# EasyEDA Pro project ProProject_电子综合板子_李冰颜_2025-12-05.epro

# Schematic 核心板
Board Name: Board1; Create Date: 2025-11-12; Page Name: P1; Project Name: 电子综合板子_李冰颜; Schematic Name: 核心板; Update Date: 2025-11-12; Company: 嘉立创EDA; Page Size: A4; Version: V1.0
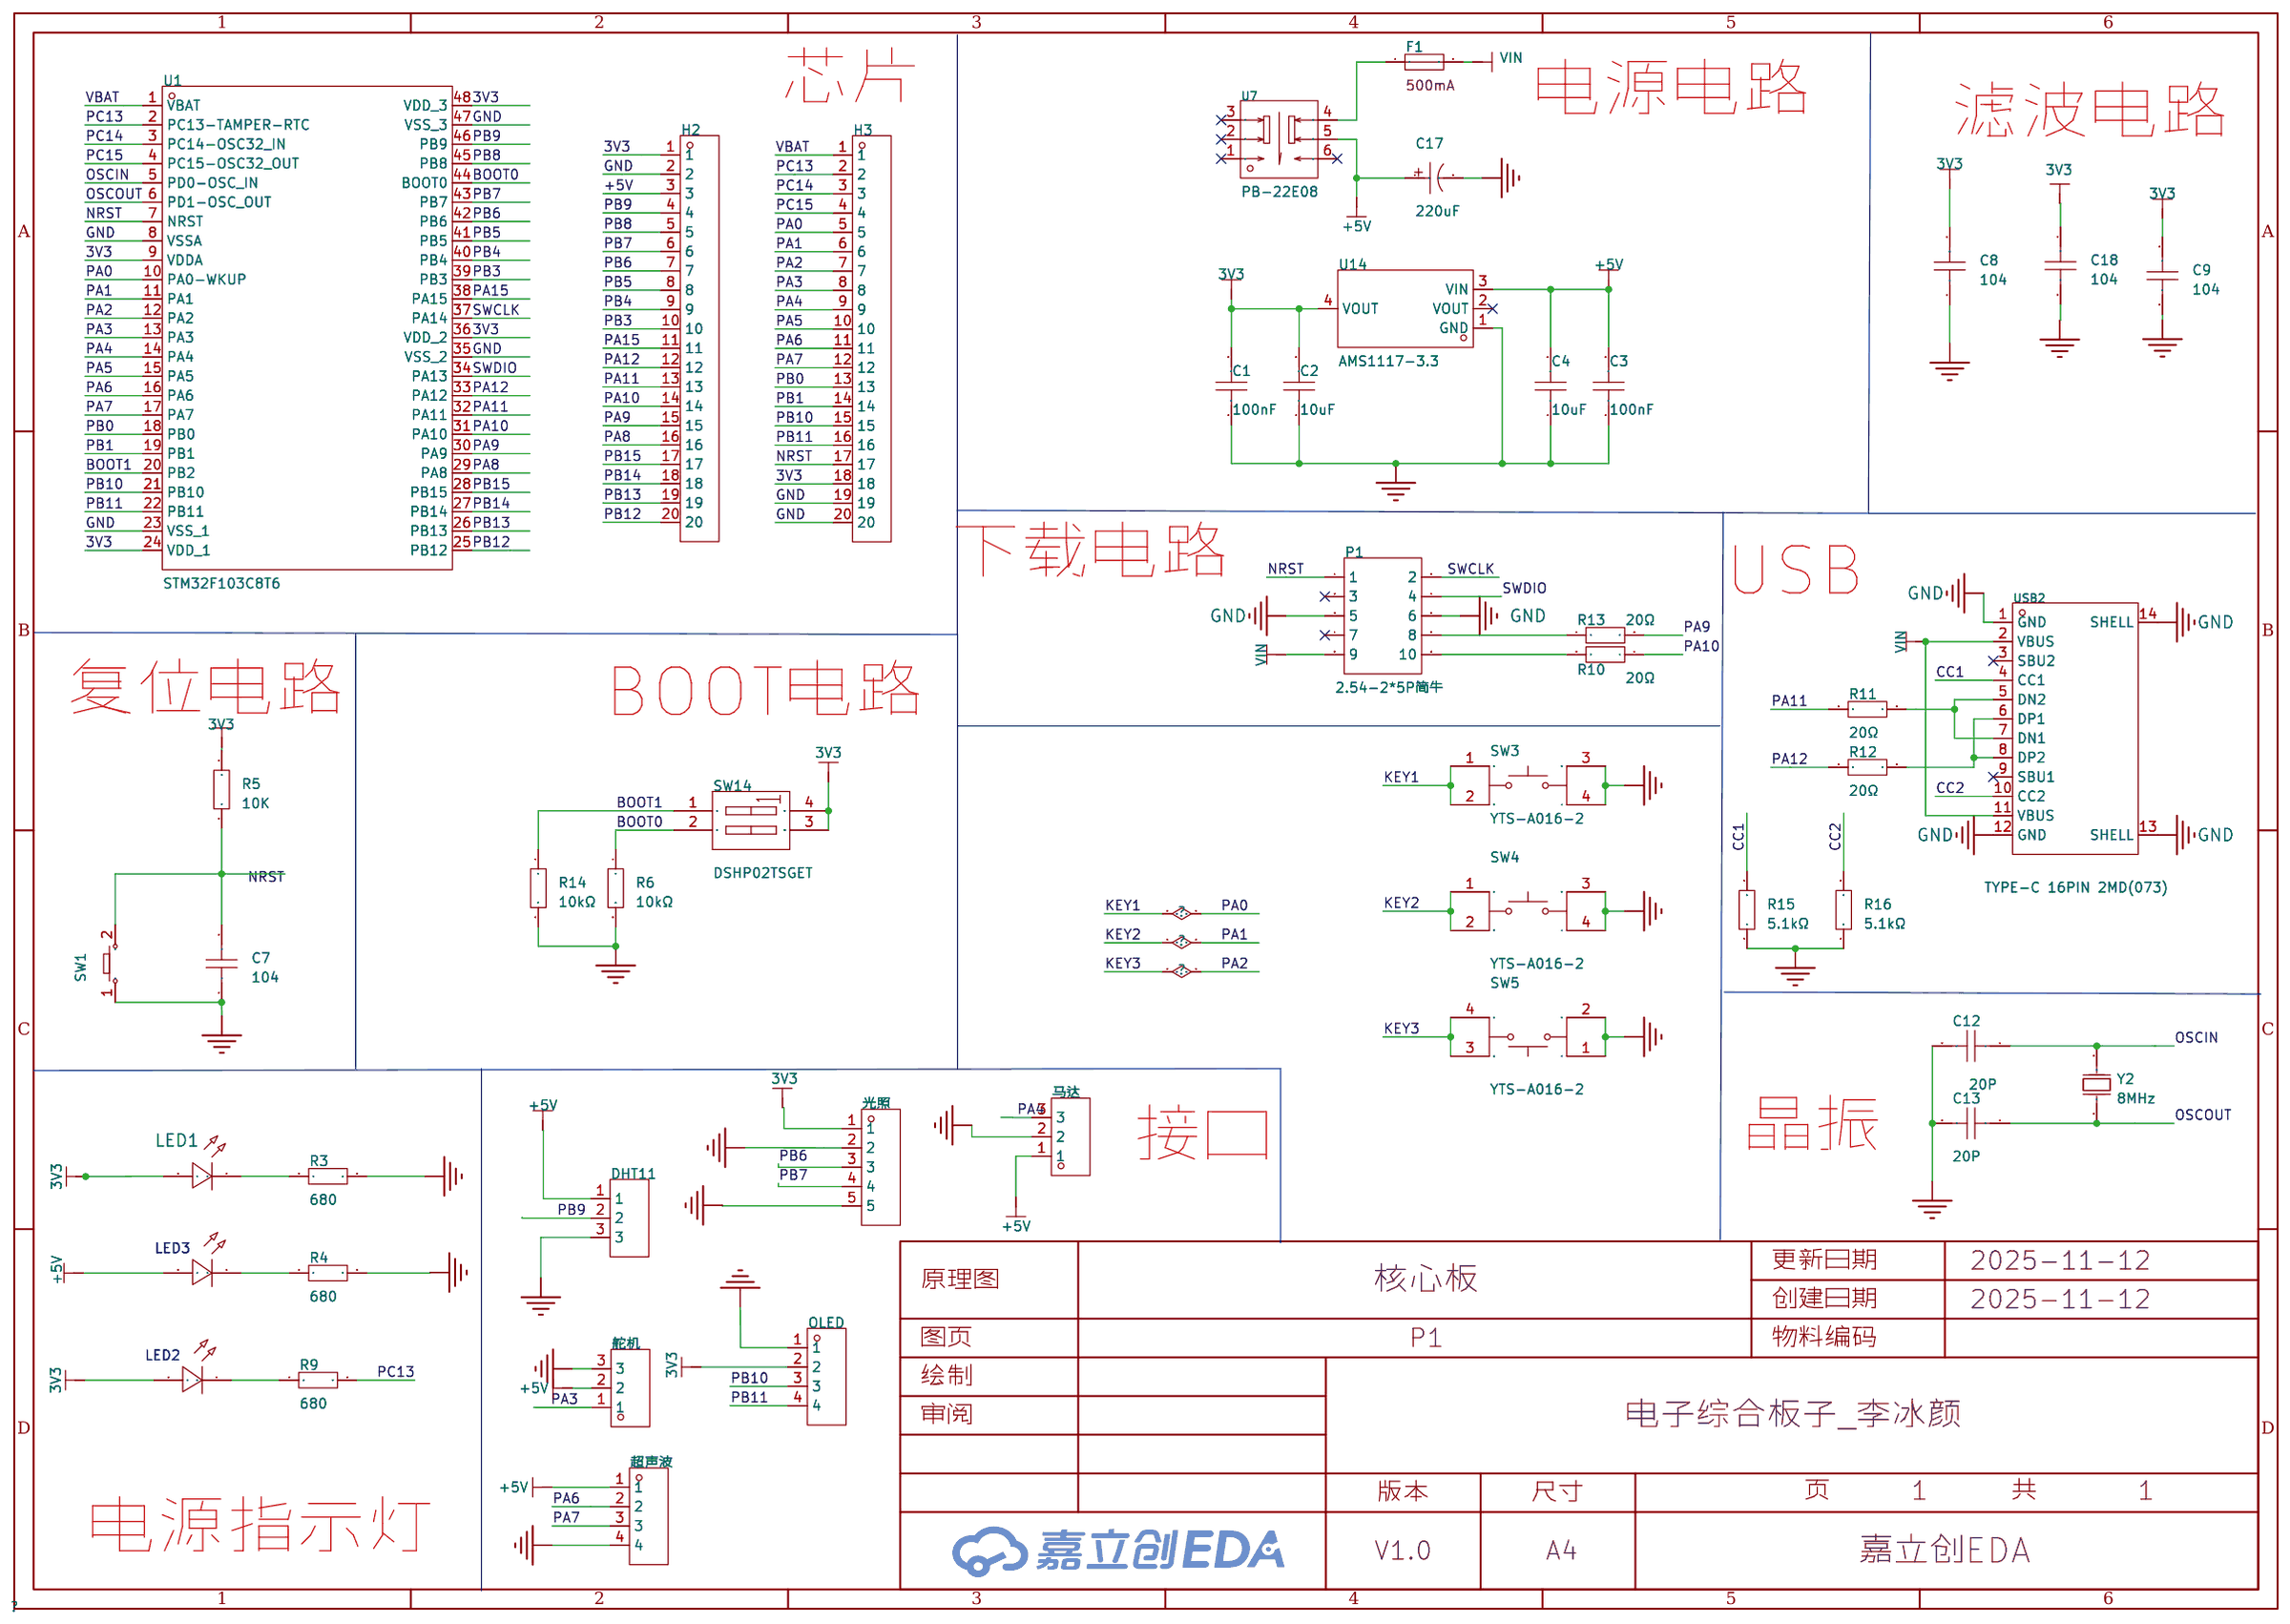
[diagram p0: schematic sheet]

## Parts
C1  100nF  [C0603]
C2  10uF  [C0603]
C3  100nF  [C0603]
C4  10uF  [C0603]
C7  104  [C0603]
C8  104  [C0603]
C9  104  [C0603]
C12  20P  [C0603]
C13  20P  [C0603]
C17  220uF  [CAP-SMD_BD6.3-L6.6-W6.6-LS7.2-R-RD]
C18  104  [C0603]
DHT11  PM254V-11-03-H85  [HDR-TH_3P-P2.54-V-F]
F1  BSMD0805-020-30V  [F0805]
H2  -  [HDR-TH_20P-P2.54-V-M-1]
H3  -  [HDR-TH_20P-P2.54-V-M-1]
LED1  -  [LED_0603]
LED2  -  [LED_0603]
LED3  -  [LED_0603]
OLED  PM254V-11-04-H85  [HDR-TH_4P-P2.54-V-F]
P1  2.54-2*5P简牛  [IDC-TH_10P-P2.54_C5665]
R3  680  [R0603]
R4  680  [R0603]
R5  10K  [R0603]
R6  10kΩ  [R0603]
R9  680  [R0603]
R10  20Ω  [R0603]
R11  20Ω  [R0603]
R12  20Ω  [R0603]
R13  20Ω  [R0603]
R14  10kΩ  [R0603]
R15  5.1kΩ  [R0603]
R16  5.1kΩ  [R0603]
SW1  -  [Key_SMD_3x4x2]
SW3  YTS-A016-2  [SW-SMD_4P-L4.2-W3.3-P2.15-LS4.7]
SW4  YTS-A016-2  [SW-SMD_4P-L4.2-W3.3-P2.15-LS4.7]
SW5  YTS-A016-2  [SW-SMD_4P-L4.2-W3.3-P2.15-LS4.7]
SW14  DSHP02TSGET  [SW-SMD_4P_DSHP02TSGET]
U1  STM32F103C8T6  [LQFP-48_L7.0-W7.0-P0.50-LS9.0-BL]
U7  PB-22E08  [SW-TH_6P-L8.0-W8.0-P2.50_PB-22E08]
U14  AMS1117-3.3  [SOT-223-3_L6.5-W3.4-P2.30-LS7.0-BR]
USB2  TYPE-C 16PIN 2MD(073)  [USB-C-SMD_TYPE-C-6PIN-2MD-073]
Y2  8MHz  [HC-49S_L11.4-W4.7-P4.88-D0.4]
光照  PM254V-11-05-H85  [HDR-TH_5P-P2.54-V-F]
舵机  -  [HDR-TH_3P-P2.54-V-M]
超声波  -  [HDR-TH_4P-P2.54-V-M]
马达  -  [HDR-TH_3P-P2.54-V-M]

## Library data of the parts
C1-C4 C7-C9 C12 C13 C18 = CAP_0603: Supplier Footprint: 0603
C17 = RVT1A221M0605: 容值:220uF;精度:±20%;额定电压:10V;纹波电流:-;等效串联电阻:-;; LCSC Part Name: 220uF ±20% 10V; Supplier Part: C3345; Manufacturer: HONOR(荣誉); Supplier Footprint: SMD,D6.3xL5.4mm; JLCPCB Part Class: 扩展库; Datasheet: https://atta.szlcsc.com/upload/public/pdf/source/20220520/1BCC52842751E84E020A4D0B70BC5F88.pdf; Supplier: LCSC; Tolerance: ±20%; Rated Voltage: 10V; φD: 6.3mm; L: 5.4mm; Lifetime @ Temp: 2000hrs@105℃; Operating Temperature: -55℃~+105℃
DHT11 = PM254V-11-03-H85: 插孔结构:1x3P;间距:2.54mm;行距:-;圆孔/方孔:方孔;安装方式:直插;排数:单排;总孔位数:3P;额定电流:3A;插孔方向:顶部;塑高:8.5mm;触头材质:黄铜;触头镀层:-;工作温度:-40℃~+105℃;; LCSC Part Name: 1x3P 间距:2.54mm 直插; Supplier Part: C541850; Manufacturer: XFCN(兴飞); Supplier Footprint: 插件,P=2.54mm; JLCPCB Part Class: 扩展库; Datasheet: https://item.szlcsc.com/datasheet/PM254V-11-03-H85/562471.html; Supplier: LCSC; Holes Structure: 1x3P; Pitch: 2.54mm; Circular Hole / Square Hole: 方孔; Mounting Type: 直插; Number of Rows: 单排; Number of Positions: 3P; Current Rating: 3A; Holes Direction: 顶部; Insulation Height: 8.5mm; Contact Material: 黄铜; Operating Temperature: -40℃~+105℃
F1 = BSMD0805-020-30V: 最大电压:30V;最大电流:40A;保持电流:200mA;跳闸电流:500mA;; LCSC Part Name: 30V 200mA 0805自恢复; Supplier Part: C883105; Manufacturer: BHFUSE(佰宏); Supplier Footprint: 0805; JLCPCB Part Class: 扩展库; Datasheet: https://atta.szlcsc.com/upload/public/pdf/source/20220223/3FD8E8A8A3681642EAEF465E16495357.pdf; Supplier: LCSC; Operating Voltage (Max): 30V; Current Rating (Max): 40A; Hold Current: 200mA; Trip Current: 500mA; Power Dissipation: 500mW; Resistance - Initial (Ri) (Min): 500mΩ; Resistance - Post Trip (R1) (Max): 3.5Ω; Maximum Time to Trip: 20ms; Operating Temperature: -40℃~+85℃
H2 H3 = HDR-M_2.54_1x20P: 间距:2.54mm;总PIN位数:20;排数:1;插针结构:-;行距:-;安装类型:直插;圆针/方针:-;额定电流:-;额定电压:-;配合针长度:-;塑高:-;触头材质:黄铜;触头镀层:-;颜色:黑色;; Supplier Part: C50981; Supplier Footprint: 插件
LED1 = LED_0603-R: Supplier Footprint: 0603
LED2 LED3 = LED_0603-B: Supplier Footprint: 0603
OLED = PM254V-11-04-H85: 插孔结构:1x4P;间距:2.54mm;行距:-;圆孔/方孔:方孔;安装方式:直插;排数:单排;总孔位数:4P;额定电流:3A;插孔方向:顶部;塑高:8.5mm;触头材质:黄铜;触头镀层:-;工作温度:-40℃~+105℃;; LCSC Part Name: 1x4P 间距:2.54mm 直插; Supplier Part: C541851; Manufacturer: XFCN(兴飞); Supplier Footprint: 插件,P=2.54mm; JLCPCB Part Class: 扩展库; Datasheet: https://item.szlcsc.com/datasheet/PM254V-11-04-H85/562472.html; Supplier: LCSC; Holes Structure: 1x4P; Pitch: 2.54mm; Circular Hole / Square Hole: 方孔; Mounting Type: 直插; Number of Rows: 单排; Number of Positions: 4P; Current Rating: 3A; Holes Direction: 顶部; Insulation Height: 8.5mm; Contact Material: 黄铜; Operating Temperature: -40℃~+105℃
P1 = 2.54-2*5P简牛: 连接器类型:简牛座;每排PIN数:5;排数:2;间距:2.54mm;行距:2.54mm;封装形式:直插;触头材质:-;触头镀层:-;; LCSC Part Name: 每排P数:5 排数:2 2.54mm; Supplier Part: C5665; Manufacturer: BOOMELE(博穆精密); Supplier Footprint: 插件,P=2.54mm; JLCPCB Part Class: 扩展库; Datasheet: https://atta.szlcsc.com/upload/public/pdf/source/20140331/1457707037896.pdf; Supplier: LCSC; Connector Type: 简牛座; Pin Number in each Row: 5; Number of Rows: 2; Pitch: 2.54mm; Row Spacing: 2.54mm; Holder Type: 直插
R3-R5 R9 = Res_0603: Supplier Footprint: 0603
R6 R14 = RC0603JR-0710KL: 电阻类型:厚膜电阻;阻值:10kΩ;精度:±5%;功率:100mW;; LCSC Part Name: 10kΩ ±5% 100mW; Supplier Part: C99198; Manufacturer: YAGEO(国巨); Supplier Footprint: 0603; JLCPCB Part Class: 扩展库; Datasheet: https://atta.szlcsc.com/upload/public/pdf/source/20181223/C99198_917934A193F41F77D9F7D214A8C79116.pdf; Supplier: LCSC; Type: 厚膜电阻; Tolerance: ±5%; Power(Watts): 100mW; Temperature Coefficient: ±100ppm/℃; Overload Voltage (Max): 75V; Operating Temperature Range: -55℃~+155℃
R10-R13 = 0603WAF200JT5E: 电阻类型:厚膜电阻;阻值:20Ω;精度:±1%;功率:100mW;; LCSC Part Name: 20Ω ±1% 100mW; Supplier Part: C22950; Manufacturer: UNI-ROYAL(厚声); Supplier Footprint: 0603; JLCPCB Part Class: Basic Part; Datasheet: https://atta.szlcsc.com/upload/public/pdf/source/20200306/C422600_1E6D84923E4A46A82E41ADD87F860B5C.pdf; Supplier: LCSC; Type: 厚膜电阻; Tolerance: ±1%; Power(Watts): 100mW; Temperature Coefficient: ±100ppm/℃; Overload Voltage (Max): 75V; Operating Temperature Range: -55℃~+155℃
R15 R16 = RMC1/16K512FTP63: 阻值:5.1kΩ;精度:±1%;功率:100mW;温度系数:±100ppm/℃;; LCSC Part Name: 5.1kΩ ±1% 100mW 停产; Supplier Part: C340528; Manufacturer: KAMAYA(釜屋電機); Supplier Footprint: 0603; Datasheet: https://atta.szlcsc.com/upload/public/pdf/source/20190312/C340533_57182A1F90EF0B6BEC7E870D19457F7C.pdf; Supplier: LCSC; Tolerance: ±1%; Power(Watts): 100mW; Temperature Coefficient: ±100ppm/℃
SW1 = Key_SMD_3x4x2: Supplier Footprint: SMD
SW3-SW5 = YTS-A016-2: 电路结构:单刀单掷;按钮形状:椭圆形按钮;作用力:2.6N;安装方式:立贴;开关长度:4.2mm;开关宽度:3.4mm;开关高度:2.5mm;带支架:不带;触点电流:50mA;额定电压(DC):12V;绝缘电阻:100MΩ;机械寿命:10万次;; LCSC Part Name: 4.2*3.4*2.5mm 立贴 轻触开关; Supplier Part: C2910673; Manufacturer: YIYUAN(怡远); Supplier Footprint: SMD; JLCPCB Part Class: 扩展库; Datasheet: https://atta.szlcsc.com/upload/public/pdf/source/20211104/F07B7201482F381EAEC9C23BE16B5334.pdf; Supplier: LCSC; Circuit: 单刀单掷; Actuator Style: 椭圆形按钮; Operating Force: 2.6N; Mounting Style: 立贴; Switch Length: 4.2mm; Switch Width: 3.4mm; Switch Height: 2.5mm; Strike Gundam: 不带; Contact Current: 50mA; Voltage Rating (DC): 12V; Insulation Resistance: 100MΩ; Actuator/Cap Color: 白色; Pin Style: J型引脚; Mechanical Life: 10万次
SW14 = DSHP02TSGET: 类型:平拨，凹槽式;电路结构:单刀单掷;开关位数:2;引脚间距:1.27mm;颜色:黑色;; LCSC Part Name: 2位 1.27间距; Supplier Part: C40735; Manufacturer: YE; Supplier Footprint: SMD-4P,4.1x5.4mm; JLCPCB Part Class: 扩展库; Datasheet: https://atta.szlcsc.com/upload/public/pdf/source/20150928/1457707425261.pdf; Supplier: LCSC; Type: 平拨，凹槽式; Circuit: 单刀单掷; Number of Positions: 2; Lead Pitch: 1.27mm; Color: 黑色
U1 = STM32F103C8T6: CPU内核:ARM-M3;程序存储容量:64KB;RAM总容量:20KB;GPIO端口数量:37;工作电压范围:2V~3.6V;CPU最大主频:72MHz;程序存储器类型:FLASH;; LCSC Part Name: 主流增强型ARM Cortex-M3 MCU，具有64 KB Flash、72 MHz CPU、电机控制、USB和CAN; Supplier Part: C8734; Manufacturer: ST(意法半导体); Supplier Footprint: LQFP-48(7x7); JLCPCB Part Class: 扩展库; Datasheet: https://atta.szlcsc.com/upload/public/pdf/source/20220812/8363ACEC51AD55ECEB84799464F7CB85.pdf; Supplier: LCSC; CPU Core: ARM-M3; Program Storage Size: 64KB; RAM Size: 20KB; GPIO Ports Number: 37; Operating Voltage Range: 2V~3.6V; CPU Maximum Speed: 72MHz; Program Memory Type: FLASH; Operating Temperature Range: -40℃~+85℃; ADC (Bit): 12bit; Universal Serial Bus: 有; Peripheral/Function: 看门狗；DMA；看门狗；温度传感器; Watchdog: 有; Infrared Data Association: 有; Low-Voltage Detect: 有; Direct Memory Access: 有; Internal Oscillator: 有
U7 = PB-22E08: LCSC Part Name: 自锁按键开关; Supplier Part: C2848958; Manufacturer: G-Switch(品赞); Supplier Footprint: 8x8mm; Datasheet: https://atta.szlcsc.com/upload/public/pdf/source/20230616/E4440AC7CE198A071B7CAB3CD31ABBEA.pdf; Supplier: LCSC
U14 = AMS1117-3.3_C6186: 输出类型:固定;最大输入电压:-;输出电压:3.3V;最大输出电流:1A;电源纹波抑制比(PSRR):72dB@(120Hz);输出极性:正极;; LCSC Part Name: 输出3.3V 1A; Supplier Part: C6186; Manufacturer: AMS; Supplier Footprint: SOT-223-3; JLCPCB Part Class: 基础库; Datasheet: https://atta.szlcsc.com/upload/public/pdf/source/20180727/C6186_7A095716F0823C02F1997A905E26C086.pdf; Supplier: LCSC; Output Type: 固定; Output Voltage: 3.3V; MAX Output Current: 1A; Power Supply Rejection Ratio (PSRR): 72dB@(120Hz); Dropout Voltage: 1.3V@(800mA); Output Polarity: 正极; Number of Outputs: 1
USB2 = TYPE-C 16PIN 2MD(073): 连接器类型:Type-C;标准:-;公母:母座;触点数量:16;端口数量:1;安装方式:卧贴;额定电流 - 电源:5A;工作温度范围:-25℃~+85℃;; LCSC Part Name: TYPE-C母座 16P 4脚插件带定位柱 不锈钢外壳 2次模顶; Supplier Part: C2765186; Manufacturer: SHOU HAN(首韩); Supplier Footprint: SMD; JLCPCB Part Class: 扩展库; Datasheet: https://item.szlcsc.com/datasheet/TYPE-C%252016PIN%25202MD(073)/2901843.html; Supplier: LCSC; Connector Type: Type-C; Gender: 母座; Mounting Type: 卧贴; Number of Contacts: 16; Number of Ports: 1; Current Rating-Power: 3A; Voltage Rating: 5V; Connect-Disconnect Life: 5千次; Detection color: 黑色; Operating Temperature: -25℃~+85℃; Mounting Style: 卧贴; Current Rating - Power (Max): 5A; Operating Temperature Range: -25℃~+85℃
Y2 = ECS-080-20-4X-DU: 频率:8MHz;常温频差:±30ppm;外接负载电容:20pF;频率稳定度(全温):±100ppm;; LCSC Part Name: 8MHz ±30ppm 20pF; Supplier Part: C2636160; Manufacturer: ECS; Supplier Footprint: HC-49S; JLCPCB Part Class: 扩展库; Datasheet: https://atta.szlcsc.com/upload/public/pdf/source/20181031/C312311_8C746D9B0903A43D812CE762944D4B2E.pdf; Supplier: LCSC; Normal temperature Frequency Tolerance: ±30ppm; External load capacitor: 20pF; Frequency Stability(Full temperature range): ±100ppm; Equivalent Series Resistance (ESR): 80Ω; Operating Temperature: -55℃~+125℃
光照 = PM254V-11-05-H85: 插孔结构:1x5P;间距:2.54mm;行距:-;圆孔/方孔:方孔;安装方式:直插;排数:单排;总孔位数:5P;额定电流:3A;插孔方向:顶部;塑高:8.5mm;触头材质:黄铜;触头镀层:-;工作温度:-40℃~+105℃;; LCSC Part Name: 1x5P 间距:2.54mm 直插; Supplier Part: C541852; Manufacturer: XFCN(兴飞); Supplier Footprint: 插件,P=2.54mm; JLCPCB Part Class: 扩展库; Datasheet: https://item.szlcsc.com/datasheet/PM254V-11-05-H85/562473.html; Supplier: LCSC; Holes Structure: 1x5P; Pitch: 2.54mm; Circular Hole / Square Hole: 方孔; Mounting Type: 直插; Number of Rows: 单排; Number of Positions: 5P; Current Rating: 3A; Holes Direction: 顶部; Insulation Height: 8.5mm; Contact Material: 黄铜; Operating Temperature: -40℃~+105℃
舵机 马达 = HDR-M_2.54_1x3P: Supplier Part: C2937625; Supplier Footprint: 插件
超声波 = HDR-M_2.54_1x4P: Supplier Part: C492403; Supplier Footprint: 插件

## Nets
3V3: C1.2 C2.2 C18.1 H2.1 H3.18 LED2.2(A) OLED.2 SW14.3(B2) SW14.4(B1) U1.9(VDDA) U1.24(VDD_1) U14.4(VOUT)
+5V: C3.2 C4.2 H2.3 U14.3(VIN) 舵机.2
GND: C1.1 C2.1 C3.1 C4.1 C7.1 C18.2 H2.2 H3.19 H3.20 OLED.1 R6.2 R14.2 R15.1 R16.1 SW3.3 SW3.4 SW4.3 SW4.4 SW5.1 SW5.2 U1.8(VSSA) U1.23(VSS_1) U14.1(GND) USB2.1(GND) USB2.12(GND) USB2.13(SHELL) USB2.14(SHELL) 舵机.3 马达.2
VBAT: H3.1 U1.1(VBAT)
VIN: USB2.2(VBUS) USB2.11(VBUS)
BOOT0: R6.1 SW14.2(A2)
BOOT1: R14.1 SW14.1(A1) U1.20(PB2)
CC1: R15.2 USB2.4(CC1)
CC2: R16.2 USB2.10(CC2)
KEY1: H3.5 SW3.1 SW3.2 U1.10(PA0-WKUP)
KEY2: H3.6 SW4.1 SW4.2 U1.11(PA1)
KEY3: H3.7 SW5.3 SW5.4 U1.12(PA2)
NRST: H3.17 U1.7(NRST)
OSCIN: U1.5(PD0-OSC_IN) Y2.2
OSCOUT: U1.6(PD1-OSC_OUT) Y2.1
PA3: H3.8 U1.13(PA3) 舵机.1
PA4: H3.9 U1.14(PA4)
PA5: H3.10 U1.15(PA5)
PA6: H3.11 U1.16(PA6)
PA7: H3.12 U1.17(PA7)
PA8: H2.16
PA9: H2.15
PA10: H2.14
PA11: H2.13 R11.1
PA12: H2.12 R12.1
PA15: H2.11
PB0: H3.13 U1.18(PB0)
PB1: H3.14 U1.19(PB1)
PB3: H2.10
PB4: H2.9
PB5: H2.8
PB6: H2.7 光照.3
PB7: H2.6 光照.4
PB8: H2.5
PB9: H2.4
PB10: H3.15 OLED.3 U1.21(PB10)
PB11: H3.16 OLED.4 U1.22(PB11)
PB12: H2.20
PB13: H2.19
PB14: H2.18
PB15: H2.17
PC13: H3.2 R9.2 U1.2(PC13-TAMPER-RTC)
PC14: H3.3 U1.3(PC14-OSC32_IN)
PC15: H3.4 U1.4(PC15-OSC32_OUT)
$1N1999: LED2.1(C) R9.1
Net-(USB2-5): USB2.5(DN2) USB2.7(DN1)
Net-(USB2-6): USB2.6(DP1) USB2.8(DP2)

Not connected (* = marked no-connect by the designer): C7 2; C8 1 2; C9 1 2; C12 1 2; C13 1 2; C17 1 2; DHT11 1 2 3; F1 1 2; LED1 1(C) 2(A); LED3 1(C) 2(A); P1 1 2 3* 4 5 6 7* 8 9 10; R3 1 2; R4 1 2; R5 1 2; R10 1 2; R11 2; R12 2; R13 1 2; SW1 1 2; U1 25(PB12) 26(PB13) 27(PB14) 28(PB15) 29(PA8) 30(PA9) 31(PA10) 32(PA11) 33(PA12) 34(PA13) 35(VSS_2) 36(VDD_2) 37(PA14) 38(PA15) 39(PB3) 40(PB4) 41(PB5) 42(PB6) 43(PB7) 44(BOOT0) 45(PB8) 46(PB9) 47(VSS_3) 48(VDD_3); U7 1* 2* 3* 4 5 6*; U14 2(VOUT)*; USB2 3(SBU2)* 9(SBU1)*; 光照 1 2 5; 超声波 1 2 3 4; 马达 1 3

## Notes on the sheet
- 芯片
- 电源电路
- 滤波电路
- 下载电路
- USB
- 复位电路
- BOOT电路
- 接口
- 晶振
- 电源指示灯

# Board PCB1
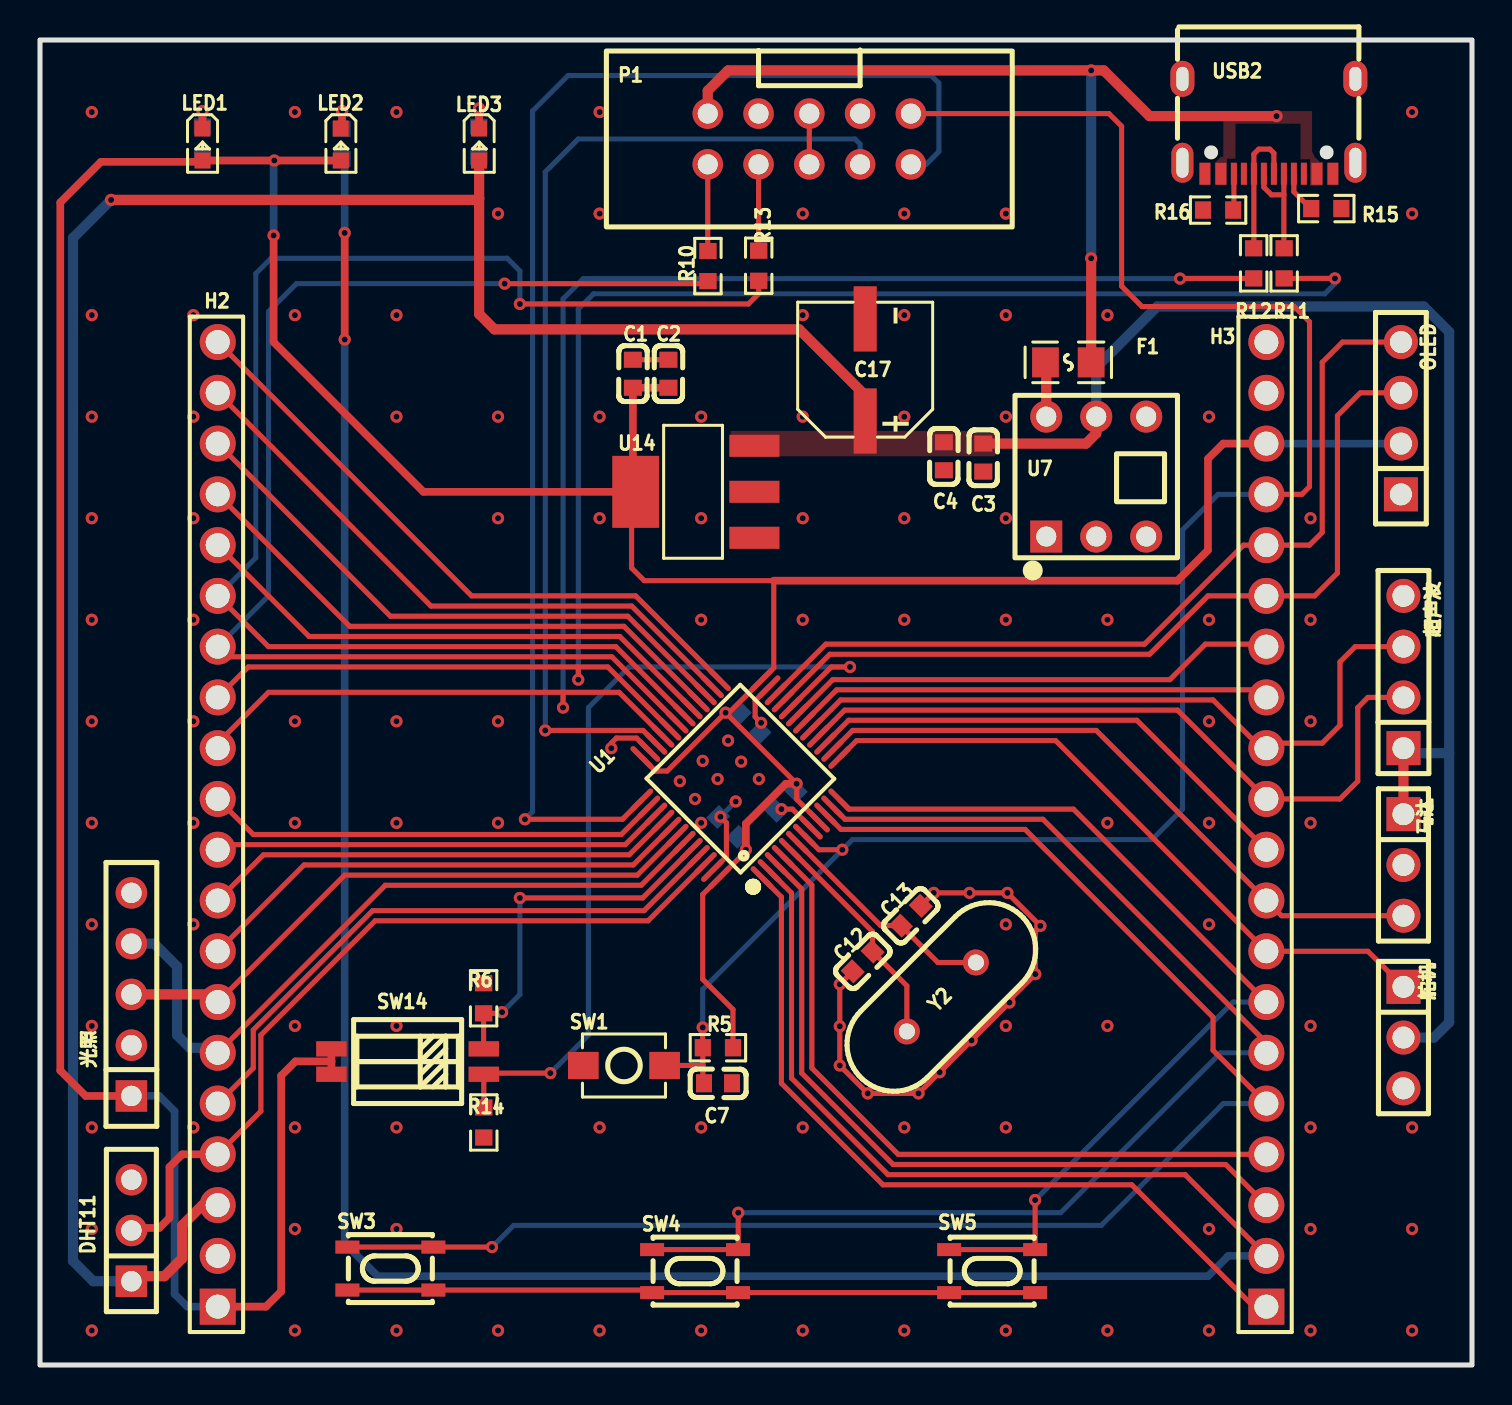
[diagram p1: board, top side]
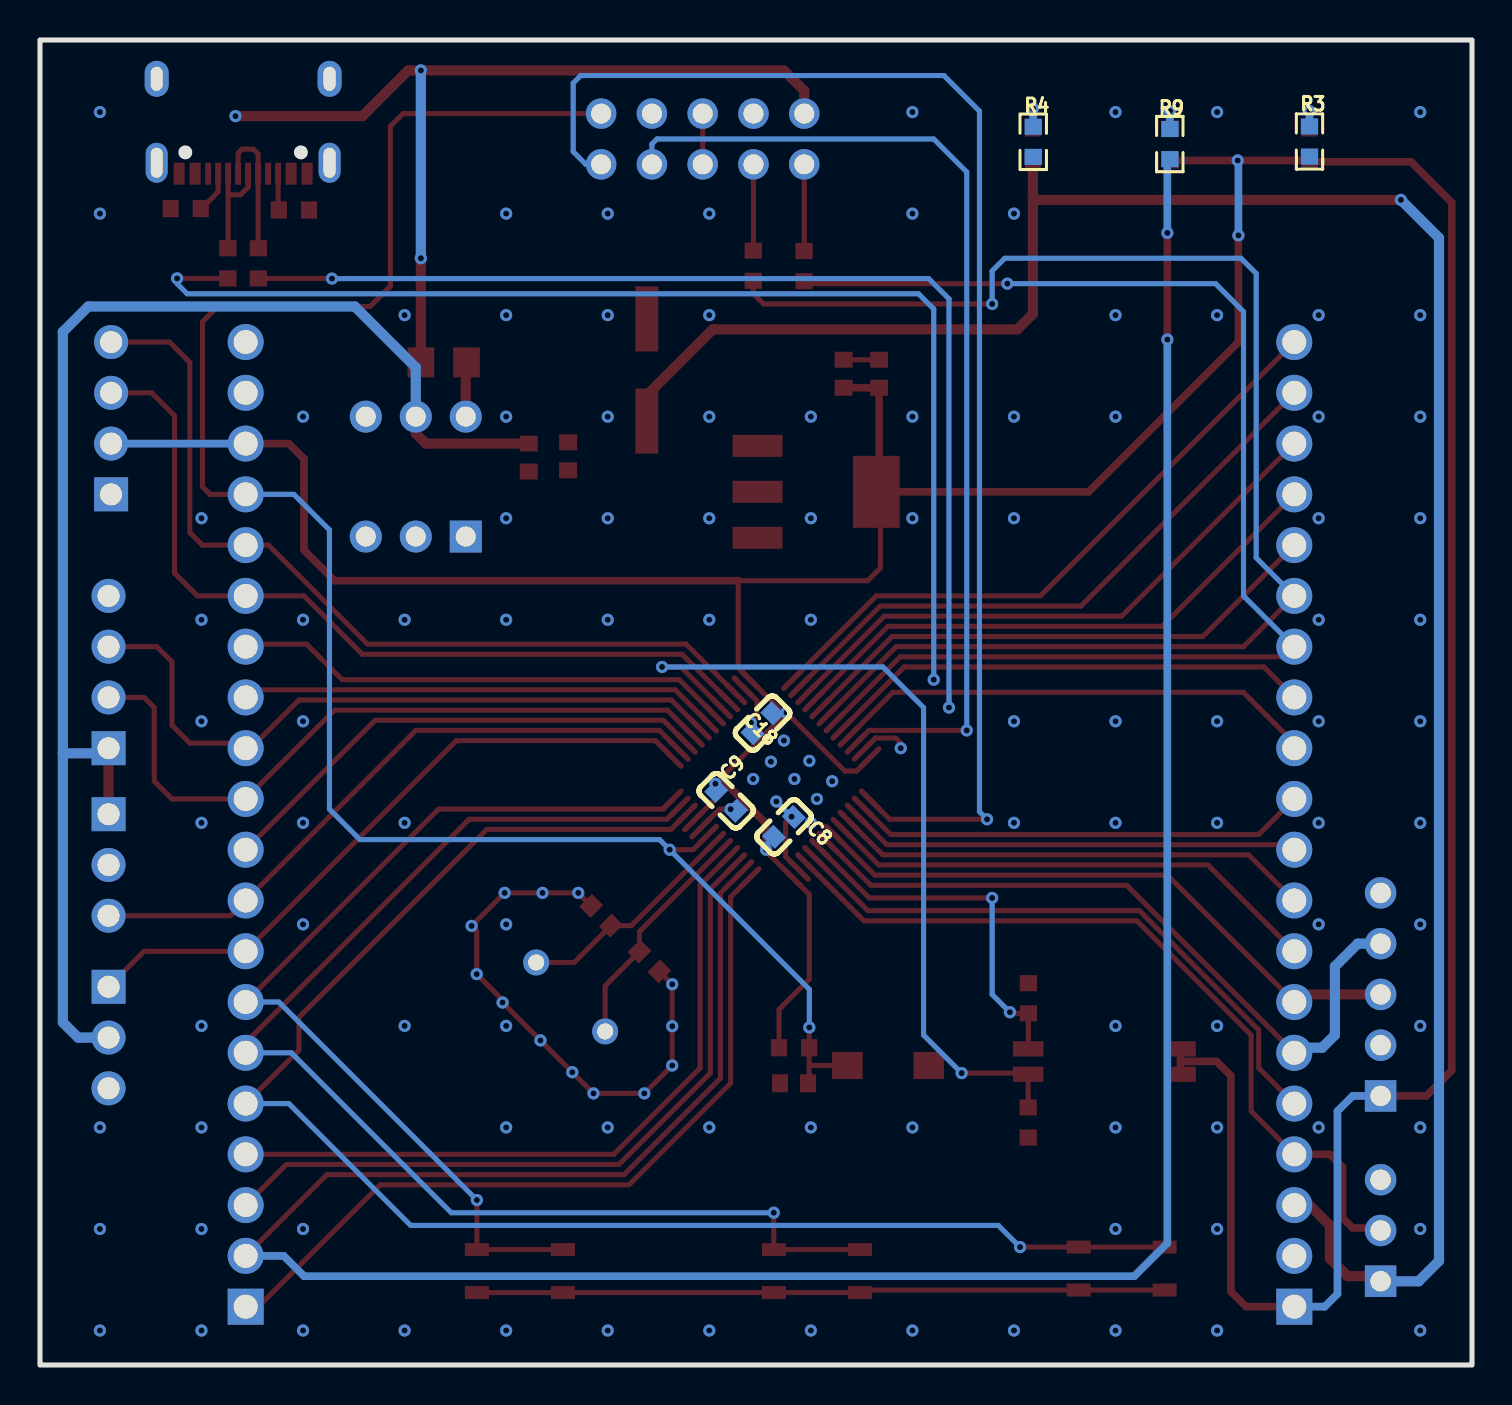
[diagram p2: board, bottom side, seen from below]

Outline 71.63 x 66.29 mm; copper layers: Top Layer, Bottom Layer. Coordinates in mm from the lower left corner of the outline.
Outline path: rectangle 0,66.29 71.63,0
Stack: Top Layer 0.035mm / Dielectric1 1.51mm FR4 er 4.5 / Bottom Layer 0.035mm

## Design rules (mm)
template: JLCPCB Capability(Two Layers Board)
spacing copperThickness1oz (default): track to track 0.102, other pairs 0.152 to 0.3
spacing copperThickness2oz: track to track 0.203, other pairs 0.152 to 0.3
track width copperThickness1oz (default): min 0.127, default 0.254, max 2.54
track width copperThickness2oz: min 0.203, default 0.254, max 2.54
differential pair differentialPair (default): width min 0.127, default 0.254, max 2.54; gap min 0.152, default 0.152
via viaSize (default): diameter min 0.5, default 0.61, max 10; hole min 0.3, default 0.305, max 6.3

## Placement (name value [footprint] x y rotation side)
C1  100nF  [C0603]  29.66 49.59 270 top
C2  10uF  [C0603]  31.43 49.59 270 top
C3  100nF  [C0603]  47.18 45.4 90 top
C4  10uF  [C0603]  45.21 45.47 90 top
C7  104  [C0603]  33.91 14.1 180 top
C8  104  [C0603]  34.42 26.92 315 bottom
C9  104  [C0603]  37.31 28.22 225 bottom
C12  20P  [C0603]  41.15 20.19 225 top
C13  20P  [C0603]  43.56 22.48 45 top
C17  220uF  [CAP-SMD_BD6.3-L6.6-W6.6-LS7.2-R-RD]  41.28 49.78 270 top
C18  104  [C0603]  35.49 32.11 315 bottom
DHT11  PM254V-11-03-H85  [HDR-TH_3P-P2.54-V-F]  4.57 6.73 90 top
F1  BSMD0805-020-30V  [F0805]  51.44 50.16 0 top
H2  -  [HDR-TH_20P-P2.54-V-M-1]  8.89 27.05 90 top
H3  -  [HDR-TH_20P-P2.54-V-M-1]  61.34 27.05 90 top
LED1  -  [LED_0603]  8.13 61.01 270 top
LED2  -  [LED_0603]  15.05 61.01 270 top
LED3  -  [LED_0603]  21.97 61.01 270 top
OLED  PM254V-11-04-H85  [HDR-TH_4P-P2.54-V-F]  68.07 47.37 90 top
P1  2.54-2*5P简牛  [IDC-TH_10P-P2.54_C5665]  38.48 61.34 180 top
R3  680  [R0603]  8.13 61.21 270 bottom
R4  680  [R0603]  21.95 61.2 270 bottom
R5  10K  [R0603]  33.91 15.87 0 top
R6  10kΩ  [R0603]  22.19 18.35 90 top
R9  680  [R0603]  15.11 61.09 270 bottom
R10  20Ω  [R0603]  33.41 54.98 90 top
R11  20Ω  [R0603]  62.23 55.12 90 top
R12  20Ω  [R0603]  60.71 55.12 90 top
R13  20Ω  [R0603]  35.95 55 270 top
R14  10kΩ  [R0603]  22.2 12.13 270 top
R15  5.1kΩ  [R0603]  64.34 57.86 180 top
R16  5.1kΩ  [R0603]  58.93 57.78 0 top
SW1  -  [Key_SMD_3x4x2]  29.21 14.99 0 top
SW3  YTS-A016-2  [SW-SMD_4P-L4.2-W3.3-P2.15-LS4.7]  17.53 4.83 0 top
SW4  YTS-A016-2  [SW-SMD_4P-L4.2-W3.3-P2.15-LS4.7]  32.77 4.7 0 top
SW5  YTS-A016-2  [SW-SMD_4P-L4.2-W3.3-P2.15-LS4.7]  47.62 4.7 180 top
SW14  DSHP02TSGET  [SW-SMD_4P_DSHP02TSGET]  18.39 15.18 90 top
U1  STM32F103C8T6  [LQFP-48_L7.0-W7.0-P0.50-LS9.0-BL]  35.05 29.34 45 top
U7  PB-22E08  [SW-TH_6P-L8.0-W8.0-P2.50_PB-22E08]  52.83 44.45 0 top
U14  AMS1117-3.3  [SOT-223-3_L6.5-W3.4-P2.30-LS7.0-BR]  32.77 43.69 0 top
USB2  TYPE-C 16PIN 2MD(073)  [USB-C-SMD_TYPE-C-6PIN-2MD-073]  61.47 61.98 180 top
Y2  8MHz  [HC-49S_L11.4-W4.7-P4.88-D0.4]  45.09 18.41 225 top
光照  PM254V-11-05-H85  [HDR-TH_5P-P2.54-V-F]  4.57 18.54 90 top
舵机  -  [HDR-TH_3P-P2.54-V-M]  68.2 16.38 270 top
超声波  -  [HDR-TH_4P-P2.54-V-M]  68.2 34.67 90 top
马达  -  [HDR-TH_3P-P2.54-V-M]  68.2 25.02 270 top

## Footprints (pads in the part's own frame, mm; a bottom-side part is the same pattern mirrored in y, then rotated)
C0603
  rect 0.8x0.9 smd: 1(-0.7,0) 2(0.7,0)
CAP-SMD_BD6.3-L6.6-W6.6-LS7.2-R-RD
  rect 3.26x1.15 smd: 1(2.555,0) 2(-2.555,0)
F0805
  rect 1.335x1.5 smd: 1(-1.143,0) 2(1.143,0)
HC-49S_L11.4-W4.7-P4.88-D0.4
  round 1.3 hole 0.8: 1(-2.44,0) 2(2.44,0)
HDR-TH_3P-P2.54-V-F
  rect 1.575x1.575 hole 1.02: 1(-2.54,0)
  round 1.575 hole 1.02: 2(0,0) 3(2.54,0)
HDR-TH_3P-P2.54-V-M
  rect 1.7x1.7 hole 1.1: 1(-2.54,0)
  round 1.7 hole 1.1: 2(0,0) 3(2.54,0)
HDR-TH_4P-P2.54-V-F
  rect 1.7x1.7 hole 1.1: 1(-3.81,0)
  round 1.7 hole 1.1: 2(-1.27,0) 3(1.27,0) 4(3.81,0)
HDR-TH_4P-P2.54-V-M
  rect 1.7x1.7 hole 1.1: 1(-3.81,0)
  round 1.7 hole 1.1: 2(-1.27,0) 3(1.27,0) 4(3.81,0)
HDR-TH_5P-P2.54-V-F
  rect 1.575x1.575 hole 1.02: 1(-5.08,0)
  round 1.575 hole 1.02: 2(-2.54,0) 3(0,0) 4(2.54,0) 5(5.08,0)
HDR-TH_20P-P2.54-V-M-1
  rect 1.8x1.8 hole 1.2: 1(-24.13,0)
  round 1.8 hole 1.2: 2(-21.59,0) 3(-19.05,0) 4(-16.51,0) 5(-13.97,0) 6(-11.43,0) 7(-8.89,0) 8(-6.35,0) 9(-3.81,0) 10(-1.27,0) 11(1.27,0) 12(3.81,0) 13(6.35,0) 14(8.89,0) 15(11.43,0) 16(13.97,0) 17(16.51,0) 18(19.05,0) 19(21.59,0) 20(24.13,0)
IDC-TH_10P-P2.54_C5665
  round 1.524 hole 1: 1(-5.08,-1.27) 2(-5.08,1.27) 3(-2.54,-1.27) 4(-2.54,1.27) 5(0,-1.27) 6(0,1.27) 7(2.54,-1.27) 8(2.54,1.27) 9(5.08,-1.27) 10(5.08,1.27)
Key_SMD_3x4x2
  rect 1.53x1.36 smd: 1(-2.035,0) 2(2.035,0)
LED_0603
  rect 0.8x0.8 smd: 1(-0.851,-0.01) 2(0.75,-0.005)
LQFP-48_L7.0-W7.0-P0.50-LS9.0-BL
  oval 0.27x1.5 smd: 1(-2.75,-4.25) 2(-2.25,-4.25) 3(-1.75,-4.25) 4(-1.25,-4.25) 5(-0.75,-4.25) 6(-0.25,-4.25) 7(0.25,-4.25) 8(0.75,-4.25) 9(1.25,-4.25) 10(1.75,-4.25) 11(2.25,-4.25) 12(2.75,-4.25) 25(2.75,4.25) 26(2.25,4.25) 27(1.75,4.25) 28(1.25,4.25) 29(0.75,4.25) 30(0.25,4.25) 31(-0.25,4.25) 32(-0.75,4.25) 33(-1.25,4.25) 34(-1.75,4.25) 35(-2.25,4.25) 36(-2.75,4.25)
  oval 1.5x0.27 smd: 13(4.25,-2.75) 14(4.25,-2.25) 15(4.25,-1.75) 16(4.25,-1.25) 17(4.25,-0.75) 18(4.25,-0.25) 19(4.25,0.25) 20(4.25,0.75) 21(4.25,1.25) 22(4.25,1.75) 23(4.25,2.25) 24(4.25,2.75) 37(-4.25,2.75) 38(-4.25,2.25) 39(-4.25,1.75) 40(-4.25,1.25) 41(-4.25,0.75) 42(-4.25,0.25) 43(-4.25,-0.25) 44(-4.25,-0.75) 45(-4.25,-1.25) 46(-4.25,-1.75) 47(-4.25,-2.25) 48(-4.25,-2.75)
R0603
  rect 0.806x0.864 smd: 1(-0.753,0) 2(0.753,0)
SOT-223-3_L6.5-W3.4-P2.30-LS7.0-BR
  rect 2.5x1.1 smd: 1(2.97,-2.3) 2(2.97,0) 3(2.97,2.3)
  rect 2.34x3.6 smd: 4(-2.97,0)
SW-SMD_4P-L4.2-W3.3-P2.15-LS4.7
  rect 1.2x0.65 smd: 1(-2.15,1.075) 2(2.15,1.075) 3(-2.15,-1.075) 4(2.15,-1.075)
SW-SMD_4P_DSHP02TSGET
  rect 0.762x1.524 smd: 1(-0.635,-3.81) 2(0.635,-3.81) 3(0.635,3.81) 4(-0.635,3.81)
SW-TH_6P-L8.0-W8.0-P2.50_PB-22E08
  rect 1.6x1.6 hole 1: 1(-2.5,-3)
  round 1.6 hole 1: 2(0,-3) 3(2.5,-3) 4(-2.5,3) 5(0,3) 6(2.5,3)
USB-C-SMD_TYPE-C-6PIN-2MD-073
  rect 0.55x1.1 smd: 1(-3.2,2.375) 2(-2.4,2.375) 11(2.4,2.375) 12(3.2,2.375)
  rect 0.3x1.1 smd: 3(-1.75,2.375) 4(-1.25,2.375) 5(-0.75,2.375) 6(-0.25,2.375) 7(0.25,2.375) 8(0.75,2.375) 9(1.25,2.375) 10(1.75,2.375)
  oval 1.1x2 hole 0.6x1.5: 13(-4.325,1.825) 14(4.325,1.825)
  oval 1.2x1.8 hole 0.6x1.2: 13(-4.325,-2.375) 14(4.325,-2.375)

## Nets
3V3: C1.2 C2.2 C8.2 C9.1 C18.1 H2.1 H3.18 LED1.2 LED2.2 OLED.2 R5.2 SW14.3 SW14.4 U1.9 U1.24 U1.36 U1.48 U14.4 光照.1
+5V: C3.2 C4.2 C17.1 DHT11.1 H2.3 LED3.2 U7.5 U14.3 舵机.2 超声波.1 马达.1
GND: C1.1 C2.1 C3.1 C4.1 C7.1 C8.1 C9.2 C12.2 C13.2 C17.2 C18.2 DHT11.3 H2.2 H3.19 H3.20 OLED.1 P1.5 P1.6 R3.2 R4.2 R6.2 R14.2 R15.1 R16.1 SW1.1 SW3.3 SW3.4 SW4.3 SW4.4 SW5.1 SW5.2 U1.8 U1.23 U1.35 U1.47 U14.1 USB2.1 USB2.12 USB2.13 USB2.14 光照.2 光照.5 舵机.3 超声波.4 马达.2
VBAT: H3.1 U1.1
VIN: F1.2 P1.9 USB2.2 USB2.11
BOOT0: R6.1 SW14.2 U1.44
BOOT1: R14.1 SW14.1 U1.20
CC1: R15.2 USB2.4
CC2: R16.2 USB2.10
KEY1: H3.5 SW3.1 SW3.2 U1.10
KEY2: H3.6 SW4.1 SW4.2 U1.11
KEY3: H3.7 SW5.3 SW5.4 U1.12
NRST: C7.2 H3.17 P1.1 R5.1 SW1.2 U1.7
OSCIN: C12.1 U1.5 Y2.2
OSCOUT: C13.1 U1.6 Y2.1
PA3: H3.8 U1.13 舵机.1
PA4: H3.9 U1.14 马达.3
PA5: H3.10 U1.15
PA6: H3.11 U1.16 超声波.2
PA7: H3.12 U1.17 超声波.3
PA8: H2.16 U1.29
PA9: H2.15 R13.2 U1.30
PA10: H2.14 R10.1 U1.31
PA11: H2.13 R11.1 U1.32
PA12: H2.12 R12.1 U1.33
PA15: H2.11 U1.38
PB0: H3.13 U1.18
PB1: H3.14 U1.19
PB3: H2.10 U1.39
PB4: H2.9 U1.40
PB5: H2.8 U1.41
PB6: H2.7 U1.42 光照.3
PB7: H2.6 U1.43 光照.4
PB8: H2.5 U1.45
PB9: DHT11.2 H2.4 U1.46
PB10: H3.15 OLED.3 U1.21
PB11: H3.16 OLED.4 U1.22
PB12: H2.20 U1.25
PB13: H2.19 U1.26
PB14: H2.18 U1.27
PB15: H2.17 U1.28
PC13: H3.2 R9.2 U1.2
PC14: H3.3 U1.3
PC15: H3.4 U1.4
SWCLK: P1.2 U1.37
SWDIO: P1.4 U1.34
$1N1572: LED1.1 R3.1
$1N1573: LED3.1 R4.1
$1N1999: LED2.1 R9.1
$1N2577: R11.2 USB2.5 USB2.7
$1N2578: R12.2 USB2.6 USB2.8
$1N2967: F1.1 U7.4
$1N3147: P1.8 R13.1
$1N3155: P1.10 R10.2

Pads without a net: P1 3 7; U7 1 2 3 6; U14 2; USB2 3 9

## Via types
v1: diameter 0.61, hole 0.305, Top Layer to Bottom Layer, 159 vias

## Routing (per net, layer and track width the routed paths; a pad name or vN(x,y) marks a point on that pad's centre or on a via; arc(x,y) is an arc through that point)
3V3: length 219.1
  Top Layer w0.254: v1(34.29,32.64) 34.47,32.64 U1.24 36.7,34.88 36.7,39.24 30.23,39.24 29.59,39.88 29.59,43.48 U14.4 ; v1(34.29,32.64) 31.37,29.72 30.78,29.72 U1.36 ; v1(34.29,32.64) v1(37.85,29.08) 37.85,28.31 U1.9 ; R5.2 34.66,17.79 33.15,19.3 33.15,23.54 U1.48 35.31,25.7 v1(35.31,25.78)
  Top Layer w0.381: v1(11.68,56.51) 11.68,51.18 19.18,43.69 U14.4 29.66,43.83 C1.2 C2.2 ; H3.18 59.18,46.1 58.42,45.34 58.42,40.77 56.9,39.24 36.7,39.24 ; LED2.2 v1(11.72,60.26) LED1.2 8.06,60.2 3.05,60.2 1.02,58.17 1.02,14.73 2.29,13.46 光照.1 ; 14.58,15.19 12.78,15.19 12.06,14.48 12.06,3.68 11.3,2.92 H2.1 ; 14.58,15.19 SW14.4 ; 14.58,15.19 SW14.3 ; v1(37.85,29.08) 37.31,29.08 35.31,27.08 v1(35.31,25.78)
  Bottom Layer w0.254: C9.1 37.85,28.77 v1(37.85,29.08) ; C18.1 34.32,32.61 v1(34.29,32.64) ; C8.2 35.31,26.03 v1(35.31,25.78)
  Bottom Layer w0.381: H2.1 7.37,2.92 6.73,3.56 6.73,12.7 5.97,13.46 光照.1 ; H3.18 OLED.2 ; v1(11.68,56.51) 11.68,60.32
+5V: length 183.9
  Top Layer w0.508: H2.3 8.13,8 7.11,6.98 7.11,5.33 6.22,4.44 4.83,4.44 DHT11.1 ; C17.1 41.28,48.51 37.97,51.82 22.73,51.82 21.97,52.58 21.97,58.37 ; 超声波.1 马达.1 ; 21.97,58.37 21.89,58.29 v1(3.56,58.29) ; 21.97,58.37 LED3.2 ; C3.2 52.32,46.1 52.83,46.61 U7.5
  Bottom Layer w0.508: 舵机.2 69.72,16.38 70.49,17.14 70.49,30.61 ; DHT11.1 2.67,4.19 1.65,5.21 1.65,56.39 v1(3.56,58.29) ; 70.49,30.61 68.45,30.61 超声波.1 ; 70.49,30.61 70.49,51.69 69.22,52.96 55.88,52.96 52.83,49.91 U7.5
GND: length 77.7
  Top Layer w0.254: v1(34.04,27.43) 34.33,27.13 34.33,25.44 33.64,24.74 ; SW3.3 SW3.4 30.49,3.75 SW4.3 SW4.4 SW5.2 SW5.1 ; v1(28.57,30.86) 28.57,31.11 28.83,31.37 29.84,31.37 30.46,30.75 ; P1.5 P1.6 ; C12.2 v1(40,19.05) v1(40,16.95) v1(40,14.99) v1(41.4,13.59) v1(43.94,13.59) v1(45,14.65) v1(46.59,16.24) v1(48.49,18.14) 48.49,18.26 v1(49.78,19.56) 49.78,21.72 v1(50.04,21.97) v1(48.39,23.62) v1(46.49,23.62) v1(44.7,23.62) C13.2 ; U1.23 35.77,33.24 35.77,32.43 v1(36.07,32.13) ; C1.1 C2.1 ; v1(37.08,27.81) 37.64,27.81 U1.8
  Bottom Layer w0.254: v1(36.07,32.13) 36.07,31.69 C18.2 ; v1(37.08,27.81) 37,27.73 C9.2 ; v1(34.04,27.43) v1(34.8,28.19)
  vias: v1(2.59,62.69) v1(2.59,52.53) v1(2.59,47.45) v1(2.59,42.37) v1(2.59,37.29) v1(2.59,32.21) v1(2.59,27.13) v1(2.59,22.05) v1(2.59,16.97) v1(2.59,11.89) v1(2.59,6.81) v1(2.59,1.73) v1(7.67,52.53) v1(7.67,47.45) v1(7.67,42.37) v1(7.67,37.29) v1(7.67,32.21) v1(7.67,27.13) v1(7.67,22.05) v1(7.67,11.89) v1(12.75,62.69) v1(12.75,52.53) v1(12.75,32.21) v1(12.75,27.13) v1(12.75,16.97) v1(12.75,11.89) v1(12.75,6.81) v1(12.75,1.73) v1(17.83,62.69) v1(17.83,52.53) v1(17.83,47.45) v1(17.83,32.21) v1(17.83,27.13) v1(17.83,16.97) v1(17.83,11.89) v1(17.83,6.81) v1(17.83,1.73) v1(22.91,57.61) v1(22.91,47.45) v1(22.91,42.37) v1(22.91,32.21) v1(22.91,27.13) v1(22.91,1.73) v1(27.99,62.69) v1(27.99,57.61) v1(27.99,47.45) v1(27.99,42.37) v1(27.99,11.89) v1(27.99,1.73) v1(32,29.21) v1(32.77,28.32) v1(33.07,47.45) v1(33.07,42.37) v1(33.07,37.29) v1(33.15,30.23) v1(33.07,27.13) v1(33.07,11.89) v1(33.07,1.73) v1(33.89,29.32) v1(34.42,31.24) v1(35.07,30.19) v1(35.96,29.32) v1(38.15,57.61) v1(38.15,52.53) v1(38.15,47.45) v1(38.15,42.37) v1(38.15,37.29) v1(38.15,11.89) v1(38.15,1.73) v1(43.23,57.61) v1(43.23,52.53) v1(43.23,47.45) v1(43.23,42.37) v1(43.23,37.29) v1(43.23,11.89) v1(43.23,1.73) v1(48.31,57.61) v1(48.31,52.53) v1(48.31,47.45) v1(48.31,42.37) v1(48.31,37.29) v1(48.31,22.05) v1(48.31,16.97) v1(48.31,11.89) v1(48.31,1.73) v1(53.39,52.53) v1(53.39,37.29) v1(53.39,27.13) v1(53.39,16.97) v1(53.39,1.73) v1(58.47,47.45) v1(58.47,37.29) v1(58.47,32.21) v1(58.47,27.13) v1(58.47,22.05) v1(58.47,6.81) v1(58.47,1.73) v1(63.55,42.37) v1(63.55,37.29) v1(63.55,32.21) v1(63.55,27.13) v1(63.55,16.97) v1(63.55,11.89) v1(63.55,6.81) v1(63.55,1.73) v1(68.63,62.69) v1(68.63,57.61) v1(68.63,11.89) v1(68.63,6.81) v1(68.63,1.73)
VBAT: length 39.6
  Top Layer w0.254: H3.1 60.71,2.92 54.61,9.02 42.16,9.02 37.08,14.1 37.08,23.42 U1.1
VIN: length 45.6
  Top Layer w0.508: v1(52.58,55.37) 52.58,50.17 ; v1(61.85,62.48) 55.5,62.48 53.21,64.77 v1(52.58,64.77) 34.42,64.77 33.4,63.75 P1.9
  Bottom Layer w0.508: v1(52.58,55.37) v1(52.58,64.77)
BOOT0: length 18.4
  Top Layer w0.254: v1(23.11,17.65) 23.06,17.6 R6.1 22.19,15.83 SW14.2 ; v1(24,23.37) 30.14,23.37 U1.44
  Bottom Layer w0.254: v1(24,23.37) 24,18.54 v1(23.11,17.65)
BOOT1: length 41.8
  Top Layer w0.254: R14.1 SW14.1 22.26,14.6 v1(25.53,14.6) ; U1.20 39.58,34.92 v1(40.51,34.92)
  Bottom Layer w0.254: v1(25.53,14.6) 27.43,16.51 27.43,32.89 29.46,34.92 v1(40.51,34.92)
CC1: length 2.1
  Top Layer w0.254: 63.59,57.86 63.55,57.86 62.72,58.69 USB2.4
CC2: length 1.8
  Top Layer w0.254: USB2.10 59.72,57.82 R16.2
KEY1: length 78
  Top Layer w0.254: H3.5 58.67,15.75 58.67,17.4 49.28,26.8 40.07,26.8 U1.10 ; SW3.1 SW3.2 v1(22.61,5.9)
  Bottom Layer w0.254: v1(22.61,5.9) 23.69,6.98 53.09,6.98 59.18,13.08 H3.5
KEY2: length 63
  Top Layer w0.254: v1(34.93,7.62) 34.93,5.78 SW4.2 SW4.1 ; 61.34,15.62 61.34,16.13 50.16,27.3 40.27,27.3 39.65,27.92
  Bottom Layer w0.254: v1(34.93,7.62) 51.05,7.62 59.06,15.62 61.34,15.62
KEY3: length 48
  Top Layer w0.254: SW5.4 SW5.3 v1(49.78,8.25) ; U1.12 40.47,27.81 51.69,27.81 H3.7
  Bottom Layer w0.254: H3.7 59.68,18.16 v1(49.78,8.25)
NRST: length 95
  Top Layer w0.254: 33.16,15.01 33.16,14.15 33.21,14.1 ; 33.16,15.01 33.13,14.99 SW1.2 ; 33.16,15.01 R5.1 33.15,15.88 v1(33.15,16.89) ; 38.23,26.51 38.96,25.78 v1(40.13,25.78) ; P1.1 53.47,62.61 54.1,61.98 54.1,53.97 55.12,52.96 62.74,52.96 63.5,52.2 63.5,43.94 63.12,43.56 H3.17
  Bottom Layer w0.254: v1(33.15,16.89) 33.15,18.8 v1(40.13,25.78) 40.64,26.29 55.63,26.29 57.15,27.81 57.15,41.78 58.93,43.56 H3.17
OSCIN: length 11.5
  Top Layer w0.254: Y2.2 43.36,18.97 C12.1 41.64,21.69 U1.5
OSCOUT: length 11.4
  Top Layer w0.254: 37.88,26.15 42.05,21.98 C13.1 44.91,20.14 Y2.1
PA3: length 33.7
  Top Layer w0.254: U1.13 40.85,31.24 50.8,31.24 H3.8 66.42,20.7 68.2,18.92
PA4: length 32.8
  Top Layer w0.254: 39.65,30.75 40.65,31.75 52.83,31.75 H3.9 62.1,22.48 马达.3
PA5: length 25.2
  Top Layer w0.254: U1.15 40.45,32.26 54.86,32.26 H3.10
PA6: length 35.9
  Top Layer w0.254: U1.16 40.25,32.77 56.9,32.77 H3.11 65.02,28.32 65.91,29.21 65.91,32.89 66.42,33.4 超声波.2
PA7: length 35.2
  Top Layer w0.254: U1.17 40.05,33.27 58.67,33.27 61.09,30.86 H3.12 61.59,31.11 64.13,31.11 65.02,32 65.02,35.18 65.79,35.94 超声波.3
PA8: length 27.1
  Top Layer w0.254: U1.29 29,36.45 13.46,36.45 H2.16
PA9: length 71
  Top Layer w0.254: U1.30 28.8,35.94 11.43,35.94 H2.15 ; v1(24,53.09) 35.43,53.09 35.95,53.6 R13.2
  Bottom Layer w0.254: H2.15 10.8,40.39 10.8,54.61 11.56,55.37 23.37,55.37 24,54.74 v1(24,53.09)
PA10: length 65
  Top Layer w0.254: U1.31 28.6,35.43 9.4,35.43 H2.14 ; v1(23.24,54.1) 33.28,54.1 R10.1
  Bottom Layer w0.254: H2.14 11.43,38.48 11.43,52.7 12.83,54.1 v1(23.24,54.1)
PA11: length 84.9
  Top Layer w0.254: 26.9,34.92 10.41,34.92 8.89,33.4 ; 26.9,34.92 26.92,34.9 v1(26.92,34.29) ; 26.9,34.92 28.4,34.92 U1.32 ; R11.1 v1(64.77,54.36)
  Bottom Layer w0.254: v1(64.77,54.36) 64.77,54.1 64.26,53.59 27.69,53.59 26.92,52.83 v1(26.92,34.29)
PA12: length 80.7
  Top Layer w0.254: R12.1 57.03,54.36 v1(57.02,54.36) ; v1(26.16,32.89) 26.16,33.63 26.14,33.65 ; 26.14,33.65 28.97,33.65 U1.33 ; 26.14,33.65 11.43,33.65 8.89,31.11 H2.12
  Bottom Layer w0.254: v1(26.16,32.89) 26.16,53.34 27.18,54.36 v1(57.02,54.36)
PA15: length 22.9
  Top Layer w0.254: H2.11 10.67,26.54 29.08,26.54 U1.38
PB0: length 23.9
  Top Layer w0.254: 61.34,33.4 60.96,33.78 39.85,33.78 38.23,32.17
PB1: length 25
  Top Layer w0.254: H3.14 61.21,36.07 58.29,36.07 56.51,34.29 39.65,34.29 U1.19
PB3: length 22.7
  Top Layer w0.254: H2.10 9.14,26.03 29.28,26.03 U1.39
PB4: length 23.9
  Top Layer w0.254: U1.40 29.47,25.53 11.18,25.53 H2.9
PB5: length 25.2
  Top Layer w0.254: U1.41 29.67,25.02 13.21,25.02 H2.8
PB6: length 30.9
  Top Layer w0.254: H2.7 15.24,24.51 29.87,24.51 U1.42
  Top Layer w0.508: 光照.3 8.51,18.54 H2.7
PB7: length 36.3
  Top Layer w0.254: 32.22,26.15 30.07,24 17.27,24 8.89,15.62
  Bottom Layer w0.508: 8.89,15.62 8.64,15.87 7.49,15.87 6.86,16.51 6.86,19.94 5.72,21.08 光照.4
PB8: length 30.3
  Top Layer w0.254: U1.45 30.22,22.73 16.64,22.73 10.67,16.76 10.67,14.86 H2.5
PB9: length 40
  Top Layer w0.254: H2.4 11.05,12.7 11.05,16.51 16.76,22.22 30.41,22.22 U1.46
  Top Layer w0.381: H2.4 7.11,10.54 6.48,9.91 6.48,7.37 5.97,6.86 4.7,6.86 DHT11.2
PB10: length 41.9
  Top Layer w0.254: OLED.3 66.04,48.64 64.9,47.5 64.9,39.62 63.75,38.48 H3.15 58.42,38.48 55.5,35.56 39.51,35.56 U1.21
PB11: length 43.5
  Top Layer w0.254: OLED.4 65.15,51.18 64.13,50.16 64.13,41.66 63.5,41.02 H3.16 60.2,41.02 55.25,36.07 39.31,36.07 U1.22
PB12: length 32.1
  Top Layer w0.254: 8.89,51.18 21.59,38.48 29.8,38.48 U1.25
PB13: length 30.8
  Top Layer w0.254: 33.64,33.93 29.6,37.97 19.56,37.97 H2.19
PB14: length 29.6
  Top Layer w0.254: U1.27 29.4,37.46 17.53,37.46 H2.18
PB15: length 28.3
  Top Layer w0.254: H2.17 15.49,36.96 29.21,36.96 32.93,33.24 U1.28
PC13: length 139.8
  Top Layer w0.254: 36.47,24.74 37.59,23.61 37.59,14.35 42.42,9.52 57.28,9.52 H3.2
  Top Layer w0.381: v1(15.24,56.64) v1(15.24,51.31)
  Bottom Layer w0.381: R9.2 15.24,60.21 v1(15.24,56.64) ; v1(15.24,51.31) 15.24,6.1 16.89,4.44 58.42,4.44 59.44,5.46 H3.2
PC14: length 37
  Top Layer w0.254: H3.3 59.31,10.03 42.67,10.03 38.1,14.6 38.1,23.81 U1.3
PC15: length 35.7
  Top Layer w0.254: H3.4 42.93,10.54 38.61,14.86 38.61,24.01 U1.4
SWCLK: length 68.1
  Top Layer w0.254: U1.37 29.13,27.3 v1(24.26,27.3)
  Bottom Layer w0.254: v1(24.26,27.3) 24.64,27.69 24.64,62.74 26.42,64.52 44.58,64.52 44.96,64.13 44.96,60.71 44.32,60.07 P1.2
SWDIO: length 51.3
  Top Layer w0.254: v1(25.27,31.75) 30.16,31.75 U1.34
  Bottom Layer w0.254: v1(25.27,31.75) 25.27,59.69 26.92,61.34 40.77,61.34 41.02,61.09 P1.4
$1N1572: length 1.6
  Top Layer w0.381: LED1.1 8.13,61.87 v1(8.13,62.74)
  Bottom Layer w0.381: R3.1 v1(8.13,62.74)
$1N1573: length 1.9
  Top Layer w0.381: LED3.1 v1(21.96,62.86)
  Bottom Layer w0.381: R4.1 21.95,62.85 v1(21.96,62.86)
$1N1999: length 1.8
  Top Layer w0.381: v1(15.11,62.74) 15.11,61.94 LED2.1
  Bottom Layer w0.381: R9.1 v1(15.11,62.74)
$1N2577: length 5.6
  Top Layer w0.254: 62.22,58.55 USB2.5 ; 62.22,58.55 62.22,56.01 62.36,55.87 ; 62.22,58.55 61.59,58.55 61.22,58.92 USB2.7
$1N2578: length 6.9
  Top Layer w0.254: R12.2 60.72,55.88 USB2.8 60.72,60.59 60.96,60.83 61.51,60.83 61.72,60.63 USB2.6
$1N2967: length 2.7
  Top Layer w0.508: F1.1 50.33,50.13 U7.4
$1N3147: length 4.5
  Top Layer w0.254: P1.8 35.94,55.76 36.08,55.63
$1N3155: length 4.4
  Top Layer w0.254: P1.10 33.4,55.63 33.39,55.63

## Copper pours and planes (outline as drawn; the poured copper is in the pictures)
+5V on Top Layer: 34.54,46.74 47.79,46.74 47.79,45.47 34.54,45.47
VIN on Top Layer: 58.77,62.74 64.17,62.74 64.17,59 58.77,59
